# Altium schematic sheet sheet2_part_templates.SchDoc
size 420 x 297 mm; SheetNumber: 2; SheetTotal: 2
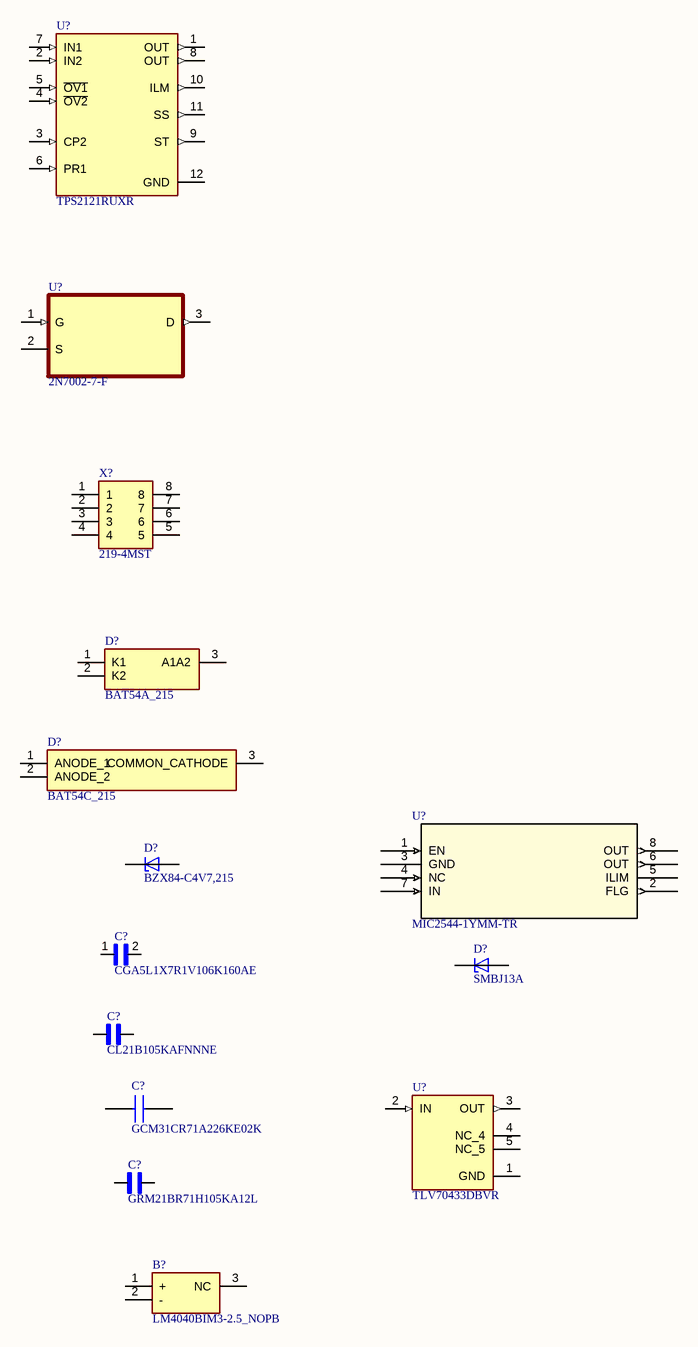
[diagram p0: sheet2_part_templates.SchDoc]

## Parts
(Parts that share a designator on the sheet are numbered #1, #2 ... from top to bottom, then left to right.)
B?  LM4040BIM3-2.5_NOPB  [SOT95P237X112-3N]
C?#1  CGA5L1X7R1V106K160AE  [CAPC3216X190N]
C?#2  CL21B105KAFNNNE  [CAPC2012X135N]
C?#3  GCM31CR71A226KE02K  [CAPC3116X180N]
C?#4  GRM21BR71H105KA12L  [CAPC2012X135N]
D?#1  BAT54A_215  [SOT95P230X110-3N]
D?#2  BAT54C_215  [BAT54C215]
D?#3  BZX84-C4V7,215  [SOT95P230X110-3N]
D?#4  SMBJ13A  [DIOM4336X265N]
U?#1  TPS2121RUXR  [FP-RUX0012A-MFG]
U?#2  2N7002-7-F  [SOT103P240X110-3N]
U?#3  MIC2544-1YMM-TR  [MSOP-8_MM_MCH]
U?#4  TLV70433DBVR  [SOT95P280X145-5N]
X?  219-4MST  [2194MST]

## Nets

Not connected (* = marked no-connect by the designer): B? 1(+) 2(-) 3(NC); C?#1 1 2; C?#2 1 2; C?#3 1 2; C?#4 1 2; D?#1 1(K1) 2(K2) 3(A1A2); D?#2 1(ANODE_1) 2(ANODE_2) 3(COMMON_CATHODE); D?#3 1(A) 3(C); D?#4 A C; U?#1 1(OUT) 2(IN2) 3(CP2) 4(~{OV2}) 5(~{OV1}) 6(PR1) 7(IN1) 8(OUT) 9(ST) 10(ILM) 11(SS) 12(GND); U?#2 1(G) 2(S) 3(D); U?#3 1(EN) 2(FLG) 3(GND) 4(NC) 5(ILIM) 6(OUT) 7(IN) 8(OUT); U?#4 1(GND) 2(IN) 3(OUT) 4(NC_4) 5(NC_5); X? 1 2 3 4 5 6 7 8

## Notes on the sheet
- THIS DOCUMENT AND THE DATA DISCLOSED HEREIN OR
- HEREWITH IS THE PROPERTY OF ALTIUM LIMITED AND MAY
- DWG NO:
- REVISION
- REV:
- DESCRIPTION
- DATE
- APPROVED
- BE FREELY DISTRIBUTED IN WHOLE. NO RIGHTS ARE
- RESERVED OR EXPRESS OR IMPLIED WARANTEE GIVEN.
- ENG:
- APPROVALS
- PROJECT
- DSN:
- CHK:
- REFERENCE DOCUMENTS
- PROJECT REVISION:
- TITLE
- DOCUMENT REVISION:
- DESIGN ITEM:
- BOM:
- FAB DWG:
- PCB DWG:
- ASSY DWG:
- SCALE:
- A3
- SIZE
- CAGE CODE
- FILE NAME
- DWG NO.
- SHEET
- OF
- REV

## Library data of the parts
B? = LM4040BIM3-2.5_NOPB: 100-ppm/C precision micropower shunt voltage reference; Manufacturer_Name: Texas Instruments; Manufacturer_Part_Number: LM4040BIM3-2.5/NOPB; Geometry.Height: 1.12mm; Mouser Part Number: 926-LM4040BIM325NOPB; Mouser Price/Stock: https://www.mouser.co.uk/ProductDetail/Texas-Instruments/LM4040BIM3-2.5-NOPB?qs=QbsRYf82W3GDmxxHwxXlYw%3D%3D; Arrow Part Number: LM4040BIM3-2.5/NOPB; Arrow Price/Stock: https://www.arrow.com/en/products/lm4040bim3-2.5nopb/texas-instruments; Datasheet Link: https://datasheet.datasheetarchive.com/originals/distributors/Datasheets-DGA16/867642.pdf
C?#1 = CGA5L1X7R1V106K160AE: 10 ÂµF Â±10% 35V é™¶ç“·ç”µå®¹å™¨ X7R 1206ï¼ˆ3216 å…¬åˆ¶ï¼‰; MF: TDK; Package: 3216 TDK; Price: None; Check_prices: https://www.snapeda.com/parts/CGA5L1X7R1V106K160AE/TDK/view-part/?ref=eda; Value: *; SnapEDA_Link: https://www.snapeda.com/parts/CGA5L1X7R1V106K160AE/TDK/view-part/?ref=snap; MP: CGA5L1X7R1V106K160AE; Availability: In Stock; Purchase-URL: https://pricing.snapeda.com/search/part/CGA5L1X7R1V106K160AE/?ref=eda
C?#2 = CL21B105KAFNNNE: 1 ÂµF Â±10% 25V Ceramic Capacitor X7R 0805 (2012 Metric); MF: Samsung Electro-Mechanics; SnapEDA_Link: https://www.snapeda.com/parts/CL21B105KAFNNNE/Samsung/view-part/?ref=snap; Package: SMD-2 Samsung; Value: *; MP: CL21B105KAFNNNE; Check_prices: https://www.snapeda.com/parts/CL21B105KAFNNNE/Samsung/view-part/?ref=eda
C?#3 = GCM31CR71A226KE02K: Capacitor GCM31 L=3.2mm W=1.6mm T=1.6mm; Manufacturer_Name: Murata Electronics; Geometry.Height: 1.8mm; Manufacturer_Part_Number: GCM31CR71A226KE02K; Mouser Part Number: 81-GCM31CR71A226KE2K; Mouser Price/Stock: https://www.mouser.co.uk/ProductDetail/Murata-Electronics/GCM31CR71A226KE02K?qs=QzBtWTOodeVgM6QlH6X51g%3D%3D; Arrow Part Number: GCM31CR71A226KE02K; Arrow Price/Stock: https://www.arrow.com/en/products/gcm31cr71a226ke02k/murata-manufacturing?region=nac; Datasheet Link: https://search.murata.co.jp/Ceramy/image/img/A01X/G101/ENG/GCM31CR71A226KE02-01A.pdf
C?#4 = GRM21BR71H105KA12L: SMD Capacitor X7R(EIA) with Capacitance: 1.0uF Tol. 10%. Rated Voltage: 50Vdc; MF: Murata; SnapEDA_Link: https://www.snapeda.com/parts/GRM21BR71H105KA12L/Murata/view-part/?ref=snap; Package: 805-2 Murata; Value: *; MP: GRM21BR71H105KA12L; Check_prices: https://www.snapeda.com/parts/GRM21BR71H105KA12L/Murata/view-part/?ref=eda
D?#1 = BAT54A_215: Diode Array 1 Pair Common Anode 30 V 200mA (DC) Surface Mount TO-236-3, SC-59, SOT-23-3; Manufacturer_Name: Nexperia; Manufacturer_Part_Number: BAT54A,215; Geometry.Height: 1.1mm; Mouser Part Number: 771-BAT54A-T/R; Mouser Price/Stock: https://www.mouser.co.uk/ProductDetail/Nexperia/BAT54A215?qs=me8TqzrmIYV%252BITv%2F8aeieg%3D%3D; Arrow Part Number: BAT54A,215; Arrow Price/Stock: https://www.arrow.com/en/products/bat54a215/nexperia.html?utm_currency=USD&region=europe; Datasheet Link: https://assets.nexperia.com/documents/data-sheet/BAT54A.pdf
D?#2 = BAT54C_215: Schottky barrier diode,BAT54C 0.2A 30V NXP BAT54C,215, Dual SMT Schottky Diode, Common Cathode, 30V 200mA, 5ns, 3-Pin TO-236AB; Manufacturer_Name: Nexperia; Geometry.Height: 1.1mm; Manufacturer_Part_Number: BAT54C,215; Mouser Part Number: 771-BAT54C-T/R; Mouser Price/Stock: https://www.mouser.co.uk/ProductDetail/Nexperia/BAT54C215?qs=me8TqzrmIYV5SKKt13YKQA%3D%3D; Arrow Part Number: BAT54C,215; Arrow Price/Stock: https://www.arrow.com/en/products/bat54c215/nexperia.html?utm_currency=USD&region=asia; Datasheet Link: https://assets.nexperia.com/documents/data-sheet/BAT54_SER.pdf
D?#3 = BZX84-C4V7,215: MF: {'manufacturer': u'Nexperia USA Inc.'}; Package: None; Price: None; Value: *; MP: BZX84-C4V7,215; Availability: Unavailable
D?#4 = SMBJ13A: 600W, 15.2V, 5%, Unidirectional, TVS; MF: Taiwan Semiconductor Corporation; SnapEDA_Link: https://www.snapeda.com/parts/SMBJ13A/taiwan/view-part/?ref=snap; Package: SMD-2 Taiwan Semiconductor; Value: *; MP: SMBJ13A; Check_prices: https://www.snapeda.com/parts/SMBJ13A/taiwan/view-part/?ref=eda
U?#1 = CMP-019-00076-1: 2.7-V to 22-V, 56-mΩ, 4.5-A, power mux with seamless switchover 12-VQFN-HR -40 to 125; Min Supply Voltage: 2.8V; Max Supply Voltage: 22V; Nominal Supply Current: 300µA; Max Operating Temperature: 125°C; Output Voltage: 22V; Pins: 12; Min Operating Temperature: -40°C
U?#2 = 2N7002-7-F: N-Channel 60 V 115mA (Ta) 370mW (Ta) Surface Mount SOT-23-3; MF: Diodes Inc.; Purchase-URL: https://pricing.snapeda.com/search/part/2N7002-7-F/?ref=eda; Package: SOT-23-3 Diodes Inc.; MP: 2N7002-7-F; Price: None; Availability: In Stock; Value: *; Check_prices: https://www.snapeda.com/parts/2N7002-7-F/Diodes+Inc./view-part/?ref=eda; SnapEDA_Link: https://www.snapeda.com/parts/2N7002-7-F/Diodes+Inc./view-part/?ref=snap
U?#3 = MIC2544-1YMM-TR: No Description Available; Manufacturer_Name: Microchip; Copyright: Copyright (C) 2026 Ultra Librarian. All rights reserved.; Manufacturer_Part_Number: MIC2544-1YMM-TR; RefDes: RefDes; Type: Type
U?#4 = TLV70433DBVR: 150-mA 24-V ultra-low-IQ low-dropout (LDO) voltage regulator; MF: Texas Instruments; SnapEDA_Link: https://www.snapeda.com/parts/TLV70433DBVR/Texas+Instruments/view-part/?ref=snap; Package: SOT-23-5 Texas Instruments; Value: *; MP: TLV70433DBVR; Check_prices: https://www.snapeda.com/parts/TLV70433DBVR/Texas+Instruments/view-part/?ref=eda
X? = 219-4MST: DIP Switches / SIP Switches; Manufacturer_Name: CTS; Geometry.Height: 4.3mm; Manufacturer_Part_Number: 219-4MST; Mouser Part Number: 774-2194MST; Mouser Price/Stock: https://www.mouser.co.uk/ProductDetail/CTS-Electronic-Components/219-4MST?qs=qNzHFtQhdJ8xGV2Z9mul9A%3D%3D; Arrow Part Number: 219-4MST; Arrow Price/Stock: https://www.arrow.com/en/products/219-4mst/cts; Datasheet Link: https://componentsearchengine.com/Datasheets/1/219-4MST.pdf